# Altium project Smart Power Supply Unit-v4.0.0.PrjPcb
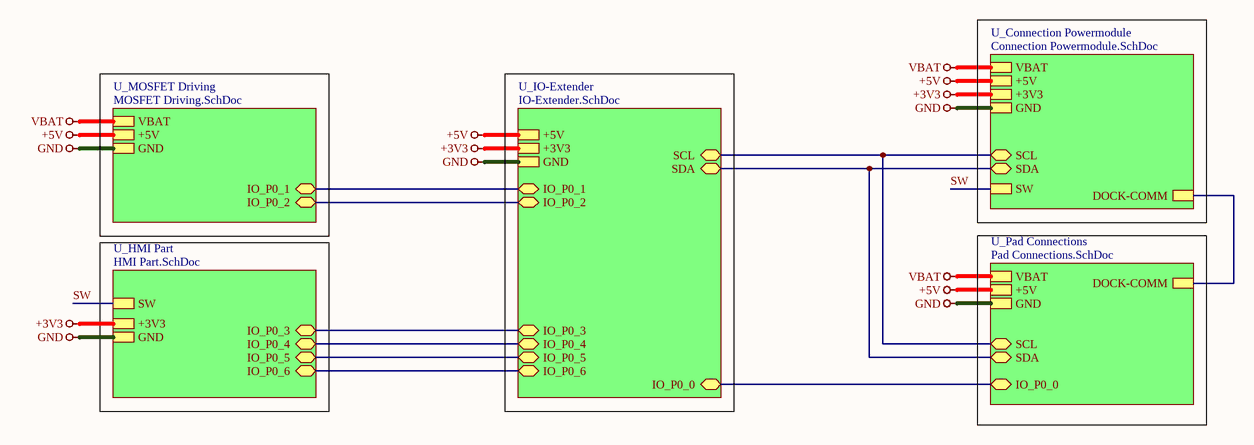
[diagram p0: Top-Sheet.SchDoc]
6 sheets, 47 parts. Net scope: hierarchical (ports join the sheet entries above them; power ports are global).
Board file: PCB_SPSU-v4.0.0.PcbDoc
Sheets:
  Top-Sheet.SchDoc
    U_IO-Extender = IO-Extender.SchDoc
    U_Connection Powermodule = Connection Powermodule.SchDoc
    U_HMI Part = HMI Part.SchDoc
    U_Pad Connections = Pad Connections.SchDoc
    U_MOSFET Driving = MOSFET Driving.SchDoc

## Sheet Top-Sheet.SchDoc
size A4; SheetNumber: 1; SheetTotal: 6

### Sub-sheets
U_Connection Powermodule = Connection Powermodule.SchDoc: VBAT, +5V, GND, SCL (bidir), SDA (bidir), SW, DOCK-COMM, +3V3
U_HMI Part = HMI Part.SchDoc: SW, IO_P0_3 (bidir), IO_P0_4 (bidir), IO_P0_5 (bidir), IO_P0_6 (bidir), +3V3, GND
U_IO-Extender = IO-Extender.SchDoc: GND, +5V, SCL (bidir), SDA (bidir), IO_P0_0 (bidir), IO_P0_1 (bidir), IO_P0_2 (bidir), IO_P0_3 (bidir), IO_P0_4 (bidir), IO_P0_5 (bidir), IO_P0_6 (bidir), +3V3
U_MOSFET Driving = MOSFET Driving.SchDoc: VBAT, +5V, GND, IO_P0_1 (bidir), IO_P0_2 (bidir)
U_Pad Connections = Pad Connections.SchDoc: VBAT, +5V, GND, SCL (bidir), SDA (bidir), IO_P0_0 (bidir), DOCK-COMM

### Nets
+3V3: sheet U_IO-Extender/+3V3, sheet U_Connection Powermodule/+3V3, sheet U_HMI Part/+3V3
+5V: sheet U_IO-Extender/+5V, sheet U_Connection Powermodule/+5V, sheet U_Pad Connections/+5V, sheet U_MOSFET Driving/+5V
GND: sheet U_IO-Extender/GND, sheet U_Connection Powermodule/GND, sheet U_HMI Part/GND, sheet U_Pad Connections/GND, sheet U_MOSFET Driving/GND
VBAT: sheet U_Connection Powermodule/VBAT, sheet U_Pad Connections/VBAT, sheet U_MOSFET Driving/VBAT
DOCK-COMM: sheet U_Connection Powermodule/DOCK-COMM, sheet U_Pad Connections/DOCK-COMM
IO_P0_0: sheet U_IO-Extender/IO_P0_0, sheet U_Pad Connections/IO_P0_0
IO_P0_1: sheet U_IO-Extender/IO_P0_1, sheet U_MOSFET Driving/IO_P0_1
IO_P0_2: sheet U_IO-Extender/IO_P0_2, sheet U_MOSFET Driving/IO_P0_2
IO_P0_3: sheet U_IO-Extender/IO_P0_3, sheet U_HMI Part/IO_P0_3
IO_P0_4: sheet U_IO-Extender/IO_P0_4, sheet U_HMI Part/IO_P0_4
IO_P0_5: sheet U_IO-Extender/IO_P0_5, sheet U_HMI Part/IO_P0_5
IO_P0_6: sheet U_IO-Extender/IO_P0_6, sheet U_HMI Part/IO_P0_6
SCL: sheet U_IO-Extender/SCL, sheet U_Connection Powermodule/SCL, sheet U_Pad Connections/SCL
SDA: sheet U_IO-Extender/SDA, sheet U_Connection Powermodule/SDA, sheet U_Pad Connections/SDA
SW: sheet U_Connection Powermodule/SW, sheet U_HMI Part/SW

### Notes on the sheet
- File:
- Title:
- Date:
- Page
- Num:
- Total:
- Drawn By: Huzaifa Ali

## Sheet IO-Extender.SchDoc
size A4; SheetNumber: 2; SheetTotal: 6
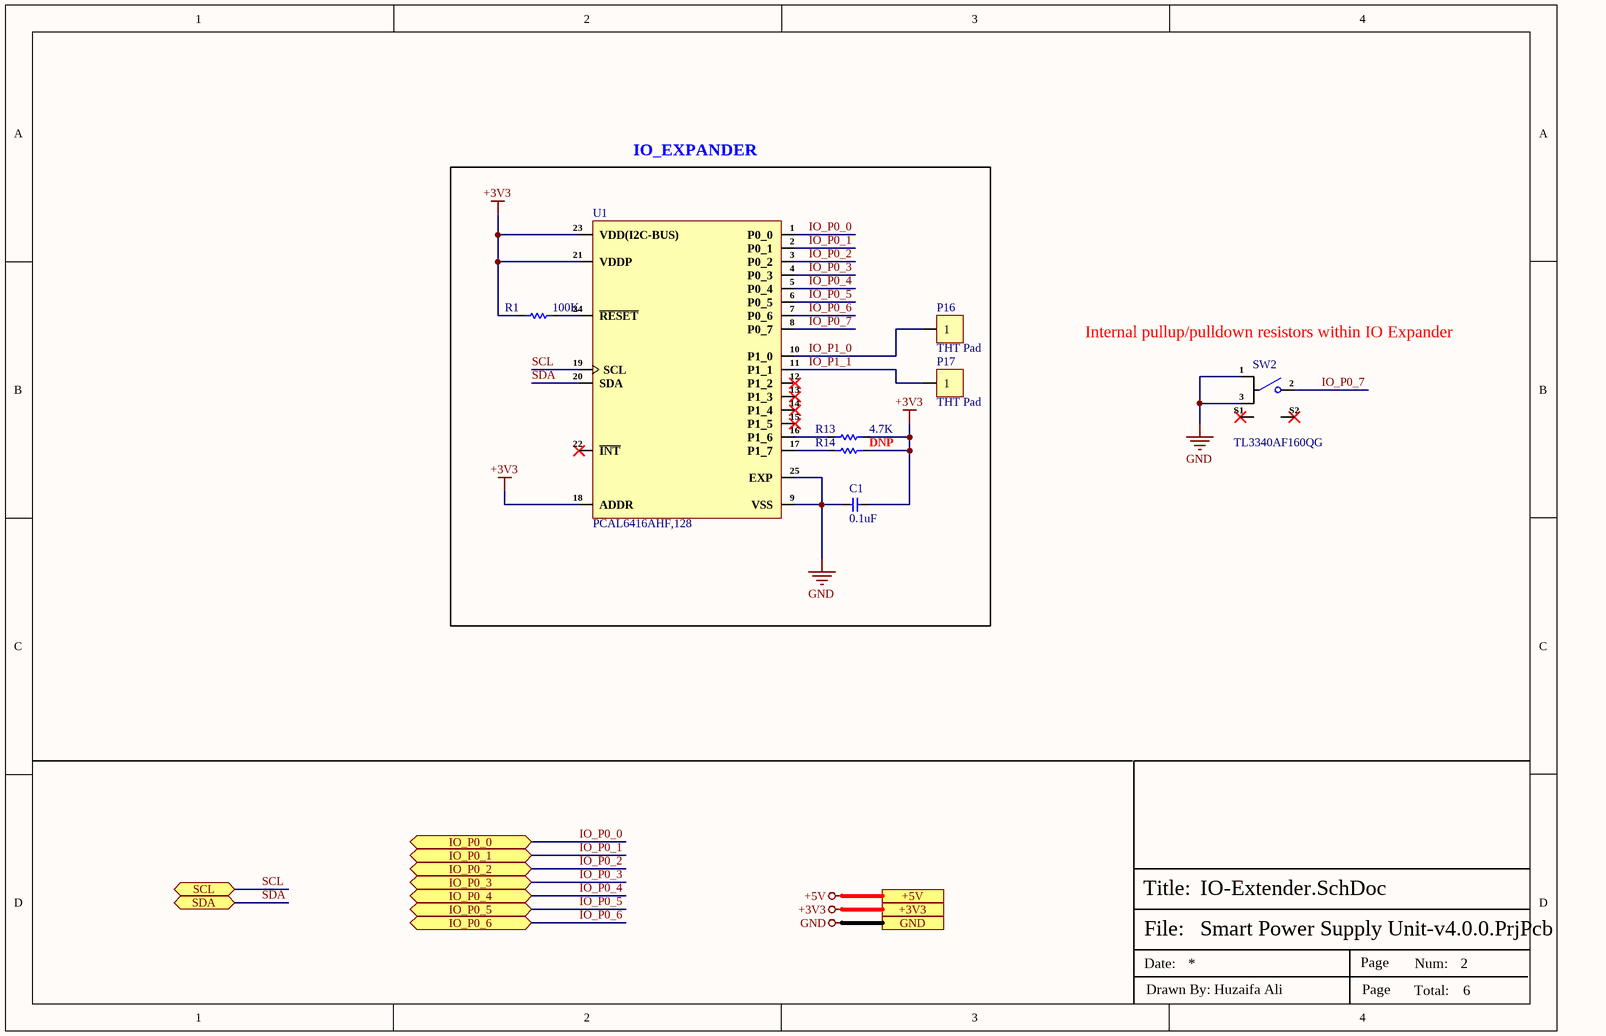
[diagram p1: IO-Extender.SchDoc]

### Parts
C1  0.1uF  [Cap-0603]
P16  THT Pad  [TH-0.75/0.6]  (no BOM)
P17  THT Pad  [TH-0.75/0.6]  (no BOM)
R1  100K  [Res-0603]
R13  4.7K  [Res-0603]
R14  DNP  [Res-0603]
SW2  TL3340AF160QG  [TL3340AF160QG]
U1  PCAL6416AHF,128  [QFN-24-EP(4x4)]

### Blocks framed on the sheet
IO_EXPANDER: C1 P16 P17 R1 R13 R14 U1

### Ports
+3V3 (see Top-Sheet[2B], Connection Powermodule[2D], HMI Part[3D]), +5V (see Top-Sheet[2B], Connection Powermodule[2D], MOSFET Driving[2D], Pad Connections[3D]), GND (see Top-Sheet[2B], Connection Powermodule[2D], HMI Part[3D], MOSFET Driving[2D], Pad Connections[3D]), IO_P0_0 (bidir, see Top-Sheet[3C], Pad Connections[1D]), IO_P0_1 (bidir, see Top-Sheet[2B], MOSFET Driving[1D]), IO_P0_2 (bidir, see Top-Sheet[2B], MOSFET Driving[1D]), IO_P0_3 (bidir, see Top-Sheet[2B], HMI Part[1D]), IO_P0_4 (bidir, see Top-Sheet[2B], HMI Part[1D]), IO_P0_5 (bidir, see Top-Sheet[2B], HMI Part[1D]), IO_P0_6 (bidir, see Top-Sheet[2B], HMI Part[1D]), SCL (bidir, see Top-Sheet[3B], Connection Powermodule[1D], Pad Connections[1D]), SDA (bidir, see Top-Sheet[3B], Connection Powermodule[1D], Pad Connections[1D])

### Nets
+3V3: C1.2 R1.2 R13.2 R14.2 U1.18(ADDR) U1.21(VDDP) U1.23(VDD(I2C-BUS)) ; port +3V3
GND: C1.1 SW2.1(COM_1) SW2.3(COM_2) U1.9(VSS) U1.25(EXP) ; port GND
IO_P0_0: U1.1(P0_0) ; port IO_P0_0
IO_P0_1: U1.2(P0_1) ; port IO_P0_1
IO_P0_2: U1.3(P0_2) ; port IO_P0_2
IO_P0_3: U1.4(P0_3) ; port IO_P0_3
IO_P0_4: U1.5(P0_4) ; port IO_P0_4
IO_P0_5: U1.6(P0_5) ; port IO_P0_5
IO_P0_6: U1.7(P0_6) ; port IO_P0_6
IO_P0_7: SW2.2(NO) U1.8(P0_7)
IO_P1_0: P16.1 U1.10(P1_0)
IO_P1_1: P17.1 U1.11(P1_1)
SCL: U1.19(SCL) ; port SCL
SDA: U1.20(SDA) ; port SDA
NetR1_1: R1.1 U1.24(~{RESET})
NetR13_1: R13.1 U1.16(P1_6)
NetR14_1: R14.1 U1.17(P1_7)

Not connected (* = marked no-connect by the designer): SW2 S1(GND)* S2(GND)*; U1 12(P1_2)* 13(P1_3)* 14(P1_4)* 15(P1_5)* 22(~{INT})*

### Notes on the sheet
- (near SW2) Internal pullup/pulldown resistors within IO Expander
- File:
- Title:
- Date:
- Page
- Num:
- Total:
- Drawn By: Huzaifa Ali

### Library data of the parts
C1 = CC0603KRX7R0BB104: CAP CER 0.1UF 100V X7R 0603; Manufacturer: Yageo; Capacitance: 100nF; Tolerance: 10%; Item Type: Capacitor; Supplier 1: Digi-Key; Manufacturer Part Number: CC0603KRX7R0BB104; RoHS: Yes; Category: Ceramic Capacitors; Stock 1: 60476; Pricing 1: 1=0.19000, 10=0.13500, 50=0.07680, 100=0.06370, 500=0.04466, 1000=0.03696 (USD); Mount: Surface Mount; Case/Package: 0603; Case Code (Metric): 1608; Case Code (Imperial): 0603; Weight: 7.1E-05oz; Min Operating Temperature: -55°C; Max Operating Temperature: 125°C; Package Quantity: 4000; Voltage Rating: 100V; Packaging: Tape and Reel; Dielectric: X7R; Termination: SMD/SMT; Resistor Type: Ceramic; Voltage Rating (DC): 100V; Series: CC; Length: 0.063inch; Width: 0.031inch; Thickness: 0.035inch; Depth: 0.8mm; Lead Free: Lead Free; RoHS Compliant: Yes; ComponentLink1URL: https://datasheet.ciiva.com/6277/mlccorderingcode-6277030.pdf?src-supplier=Digi-Key; ComponentLink1Description: https://datasheet.ciiva.com/6277/mlccorderingcode-6277030.pdf?src-supplier=Digi-Key; ComponentLink2URL: https://datasheet.ciiva.com/6277/mlccorderingcode-6277081.pdf?src-supplier=Digi-Key; ComponentLink2Description: https://datasheet.ciiva.com/6277/mlccorderingcode-6277081.pdf?src-supplier=Digi-Key; ComponentLink3URL: https://datasheet.ciiva.com/6277/mlccorderingcode-6277082.pdf?src-supplier=Digi-Key; ComponentLink3Description: https://datasheet.ciiva.com/6277/mlccorderingcode-6277082.pdf?src-supplier=Digi-Key; Supplier Part Number 1: 311-1523-1-ND; LCSC Part Number: C113803
P16 P17 = TH-0.75/0.6
R1 = RC0603JR-07100KL: RES 100K OHM 5% 1/10W 0603; Manufacturer: Yageo; Resistance: 100kR; Temperature Coefficient: 100ppm/°C; Voltage Rating: 50V; Power Rating: 100mW; Item Type: Resistor; Supplier 1: Digi-Key; Manufacturer Part Number: RC0603JR-07100KL; RoHS: Yes; Category: Chip SMD Resistors; Stock 1: 1210037; Pricing 1: 1=0.10000, 10=0.02000, 100=0.00800, 1000=0.00360, 2500=0.00312 (USD); Case/Package: 0603; Number of Pins: 2; Contact Plating: Tin,Matte; Case Code (Imperial): 0603; Case Code (Metric): 1608; Size Code: 0603; Min Operating Temperature: -55°C; Max Operating Temperature: 155°C; Tolerance: 5%; Resistor Type: Thick Film; Packaging: Tape and Reel; Voltage Rating (DC): 50V; Termination: SMD/SMT; Features: Moisture Resistant; Series: RC; Max Power Dissipation: 100mW; Number of Terminations: 2; Resistance Tolerance: 5%; Width: 0.8mm; Radiation Hardening: No; REACH SVHC: No SVHC; Lead Free: Lead Free; RoHS Compliant: Yes; ComponentLink1URL: https://datasheet.ciiva.com/7746/443971-7746424.pdf?src-supplier=Element14; ComponentLink1Description: https://datasheet.ciiva.com/7746/443971-7746424.pdf?src-supplier=Element14; ComponentLink2URL: https://datasheet.ciiva.com/7983/443971-7983686.pdf?src-supplier=Element14; ComponentLink2Description: https://datasheet.ciiva.com/7983/443971-7983686.pdf?src-supplier=Element14; ComponentLink3URL: https://datasheet.ciiva.com/7746/443971-7746423.pdf?src-supplier=Element14; ComponentLink3Description: https://datasheet.ciiva.com/7746/443971-7746423.pdf?src-supplier=Element14; ComponentLink4URL: https://datasheet.ciiva.com/8887/pyu-rc0603-51-rohs-l-4-8887903.pdf?src-supplier=Avnet; ComponentLink4Description: https://datasheet.ciiva.com/8887/pyu-rc0603-51-rohs-l-4-8887903.pdf?src-supplier=Avnet; Supplier Part Number 1: 311-100KGRCT-ND; LCSC Part Number: C100048
R13 = RC0603FR-074K7L: RES SMD 4.7K OHM 1% 1/10W 0603; Manufacturer: Yageo; Item Type: Resistor; Manufacturer Part Number: RC0603FR-074K7L; Package: 0603; ComponentLink7Description: LCSC; ComponentLink7URL: https://www.lcsc.com/product-detail/Chip-Resistor-Surface-Mount_YAGEO-RC0603FR-074K7L_C99782.html; LCSC Part Number: C99782
R14 = DNP: Item Type: Resistor; Package: 0603; ComponentLink1Description: LCSC
SW2 = TL3340AF160QG: Switch Tactile N.O. SPST Round Button Gull Wing 0.05A 12VDC 100000Cycles 1.57N SMD; Manufacturer: E-Switch; Actuator Material: Polyphthalamide; Number of Positions: 2NUMBER; Contact Current Rating: 50mA; Operating Force: 160gf; Voltage Rating (DC): 12V; Contact Resistance: 500mR; Illumination Type: Non-Illuminated,Illuminated; Switch Travel: 0.2mm; Switch Function: Off-Mom; Actuator Type: Standard; Actuator Length: 0.85mm; Supplier: Future Electronics; Supplier Part Number: 9232661; Manufacturer Part Number: TL3340AF160QG; RoHS: Yes; Category: Tactile Switches; Stock: 16000; Pricing: 2000=0.27 (USD); Mounting Technology: Surface Mount; Case/Package: SMD/SMT; Contact Material: Stainless Steel,Silver; Contact Plating: Stainless Steel,Silver; Color: White; Mechanical Life: 100000Cycles; Housing Material: Polyphthalamide; Min Operating Temperature: -35°C; Max Operating Temperature: 85°C; Throw Configuration: SPST; Package Quantity: 1; Packaging: Tape and Reel; Current Rating: 50mA; Max Voltage Rating (DC): 12V; Termination: Gull Wing; Electrical Life: 100000Cycles; Orientation: Right Angle; Series: TL3340; Height: 3.55mm; Size: 3.3mm; Reach SVHC Compliant: No; Lead Free: 5697LeadFree; RoHS Compliant: Yes; ComponentLink1URL: https://datasheet.ciiva.com/7637/tl3340-7637667.pdf?src-supplier=Element14; ComponentLink1Description: https://datasheet.ciiva.com/7637/tl3340-7637667.pdf?src-supplier=Element14; ComponentLink2URL: https://datasheet.ciiva.com/5284/tl3340-28153-5284108.pdf?src-supplier=Mouser; ComponentLink2Description: https://datasheet.ciiva.com/5284/tl3340-28153-5284108.pdf?src-supplier=Mouser; ComponentLink3URL: https://datasheet.ciiva.com/2900/p021301b-2900825.pdf?src-supplier=Digikey; ComponentLink3Description: https://datasheet.ciiva.com/2900/p021301b-2900825.pdf?src-supplier=Digikey; ComponentLink4URL: https://datasheet.ciiva.com/2900/p021301b-2900826.pdf?src-supplier=Digikey; ComponentLink4Description: https://datasheet.ciiva.com/2900/p021301b-2900826.pdf?src-supplier=Digikey; ComponentLink5URL: https://datasheet.ciiva.com/2900/p021301b-2900827.pdf?src-supplier=Digikey; ComponentLink5Description: https://datasheet.ciiva.com/2900/p021301b-2900827.pdf?src-supplier=Digikey
U1 = PCAL6416AHF,128: IC XPND 400KHZ I2C SMBUS 24HWQFN; Manufacturer: NXP Semiconductors; Min Supply Voltage: 1.65V; Max Supply Voltage: 5.5V; Output Current: 25mA; Number of I/Os: 16; Clock Frequency: 100kHz; Nominal Supply Current: 1.1mA; Supplier: Avnet; Supplier Part Number: 75X0096; Manufacturer Part Number: PCAL6416AHF,128; RoHS: Yes; Category: Interface ICs; Stock: 5086; Pricing: 1=1.23, 10=1.05, 25=0.969, 50=0.887 (USD); Mounting Technology: Surface Mount; Pins: 24; Min Operating Temperature: -40°C; Max Operating Temperature: 85°C; Packaging: Tape and Reel; Package Quantity: 1; Interface: I2C; Frequency: 400kHz; Series: -; Height: 800um; Reach SVHC Compliant: No; Lead Free: Lead Free; RoHS Compliant: Yes; ComponentLink1URL: https://datasheet.ciiva.com/46433/1845292-46433847.pdf?src-supplier=Element14; ComponentLink1Description: https://datasheet.ciiva.com/46433/1845292-46433847.pdf?src-supplier=Element14; ComponentLink2URL: https://datasheet.ciiva.com/6633/pcal6416a-6633094.pdf?src-supplier=Digikey; ComponentLink2Description: https://datasheet.ciiva.com/6633/pcal6416a-6633094.pdf?src-supplier=Digikey; ComponentLink3URL: https://datasheet.ciiva.com/6633/pcal6416a-6633096.pdf?src-supplier=Digikey; ComponentLink3Description: https://datasheet.ciiva.com/6633/pcal6416a-6633096.pdf?src-supplier=Digikey; LCSC Part Number: C2652287; Item Type: IC

## Sheet Connection Powermodule.SchDoc
size A4; SheetNumber: 3; SheetTotal: 6
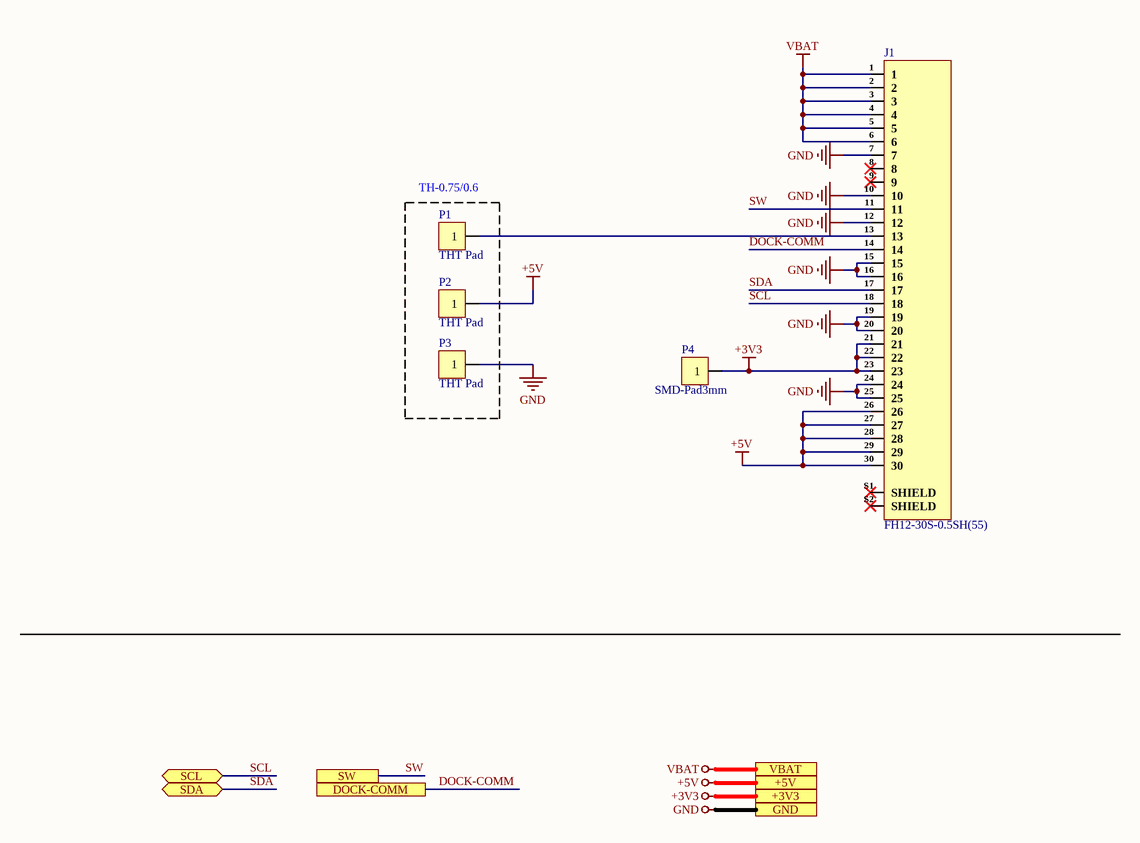
[diagram p2: Connection Powermodule.SchDoc]

### Parts
J1  FH12-30S-0.5SH(55)  [FH12-30S-0.5SH(55)]
P1  THT Pad  [TH-0.75/0.6]  (no BOM)
P2  THT Pad  [TH-0.75/0.6]  (no BOM)
P3  THT Pad  [TH-0.75/0.6]  (no BOM)
P4  SMD-Pad3mm  [3mm SMD PAD]  (no BOM)

### Blocks framed on the sheet
TH-0.75/0.6: P1-P3

### Ports
+3V3 (see Top-Sheet[3A], IO-Extender[3D]), +5V (see Top-Sheet[3A], HMI Part[3D], IO-Extender[3D], MOSFET Driving[2D], Pad Connections[3D]), DOCK-COMM (see Top-Sheet[4B], Pad Connections[1D]), GND (see Top-Sheet[3A], HMI Part[3D], IO-Extender[3D], MOSFET Driving[2D], Pad Connections[3D]), SCL (bidir, see Top-Sheet[3B], IO-Extender[1D], Pad Connections[1D]), SDA (bidir, see Top-Sheet[3B], IO-Extender[1D], Pad Connections[1D]), SW (see Top-Sheet[3B], HMI Part[2D]), VBAT (see Top-Sheet[3A], MOSFET Driving[2D], Pad Connections[3D])

### Nets
+3V3: J1.21 J1.22 J1.23 P4.1 ; port +3V3
+5V: J1.26 J1.27 J1.28 J1.29 J1.30 P2.1 ; port +5V
GND: J1.7 J1.10 J1.12 J1.15 J1.16 J1.19 J1.20 J1.24 J1.25 P3.1 ; port GND
VBAT: J1.1 J1.2 J1.3 J1.4 J1.5 J1.6 ; port VBAT
DOCK-COMM: J1.14 ; port DOCK-COMM
SCL: J1.18 ; port SCL
SDA: J1.17 ; port SDA
SW: J1.11 ; port SW
NetJ1_13: J1.13 P1.1

Not connected (* = marked no-connect by the designer): J1 8* 9* S1(SHIELD)* S2(SHIELD)*

### Notes on the sheet
- File:
- Title:
- Date:
- Page
- Num:
- Total:
- Drawn By: Huzaifa Ali

### Library data of the parts
J1 = FH12-30S-0.5SH(55): CONN FFC BOTTOM 30POS 0.5MM R/A; Manufacturer: Hirose; Actuator Material: Polyphenylene; Actuator Color: Brown; Contact Resistance: 50mR; Current Rating: 500mA; Gender: Female; Voltage Rating: 50V; Max Current Rating: 400mA; Mating Cycles: 20; Number of Positions: 30; Insulation Resistance: 500MR; Wire/Cable Type: Straight; Connector Type: 4640ConnectorType; Contact Pitch: 500um; Item Type: FFC/FPC Connector; Supplier: Future Electronics; Supplier Part Number: 7018136; Manufacturer Part Number: FH12-30S-0.5SH(55); RoHS: Yes; Category: FFC / FPC; Stock: 1200; Pricing: 1=2.27, 15=2.07, 50=1.97, 250=1.85, 1000=1.75 (USD); Mounting Technology: Surface Mount; Contact Material: Bronze; Contact Plating: Gold; Color: Beige,Brown; Housing Color: Beige; Housing Material: Polyamide; Material: Polyamide; Min Operating Temperature: -40°C; Max Operating Temperature: 70°C; Number of Rows: 1; Package Quantity: 2000; Packaging: Tape and Reel; Voltage Rating (AC): 50V; Termination: Solder; Number of Contacts: 30; Max Voltage Rating (AC): 50V; Orientation: Right Angle; Series: FH12; Contact Location: Bottom; Contact Voltage Rating (AC): 50V; Length: 19.1mm; Width: 19.1mm; Lead Pitch: 0.5mm; Pitch: 0.5mm; Depth: 5.6mm; Radiation Hardening: No; Reach SVHC Compliant: No; Lead Free: Lead Free; Flammability Rating: UL94 V-0; RoHS Compliant: Yes; ComponentLink1URL: https://datasheet.ciiva.com/11745/0900766b80d985fc-11745247.pdf?src-supplier=Rs; ComponentLink1Description: https://datasheet.ciiva.com/11745/0900766b80d985fc-11745247.pdf?src-supplier=Rs; ComponentLink2URL: https://datasheet.ciiva.com/15176/getdatasheetpartid-439676-15176854.pdf?src-supplier=Verical; ComponentLink2Description: https://datasheet.ciiva.com/15176/getdatasheetpartid-439676-15176854.pdf?src-supplier=Verical; ComponentLink3URL: https://datasheet.ciiva.com/7661/58803-7661387.pdf?src-supplier=Element14; ComponentLink3Description: https://datasheet.ciiva.com/7661/58803-7661387.pdf?src-supplier=Element14; ComponentLink4URL: https://datasheet.ciiva.com/22630/58803-22630360.pdf?src-supplier=Farnell; ComponentLink4Description: https://datasheet.ciiva.com/22630/58803-22630360.pdf?src-supplier=Farnell; LCSC Part Number: C506793
P1-P3 = TH-0.75/0.6
P4 = SMD-Pad3mm: Wire Conncting PAD

## Sheet HMI Part.SchDoc
size A4; SheetNumber: 6; SheetTotal: 6
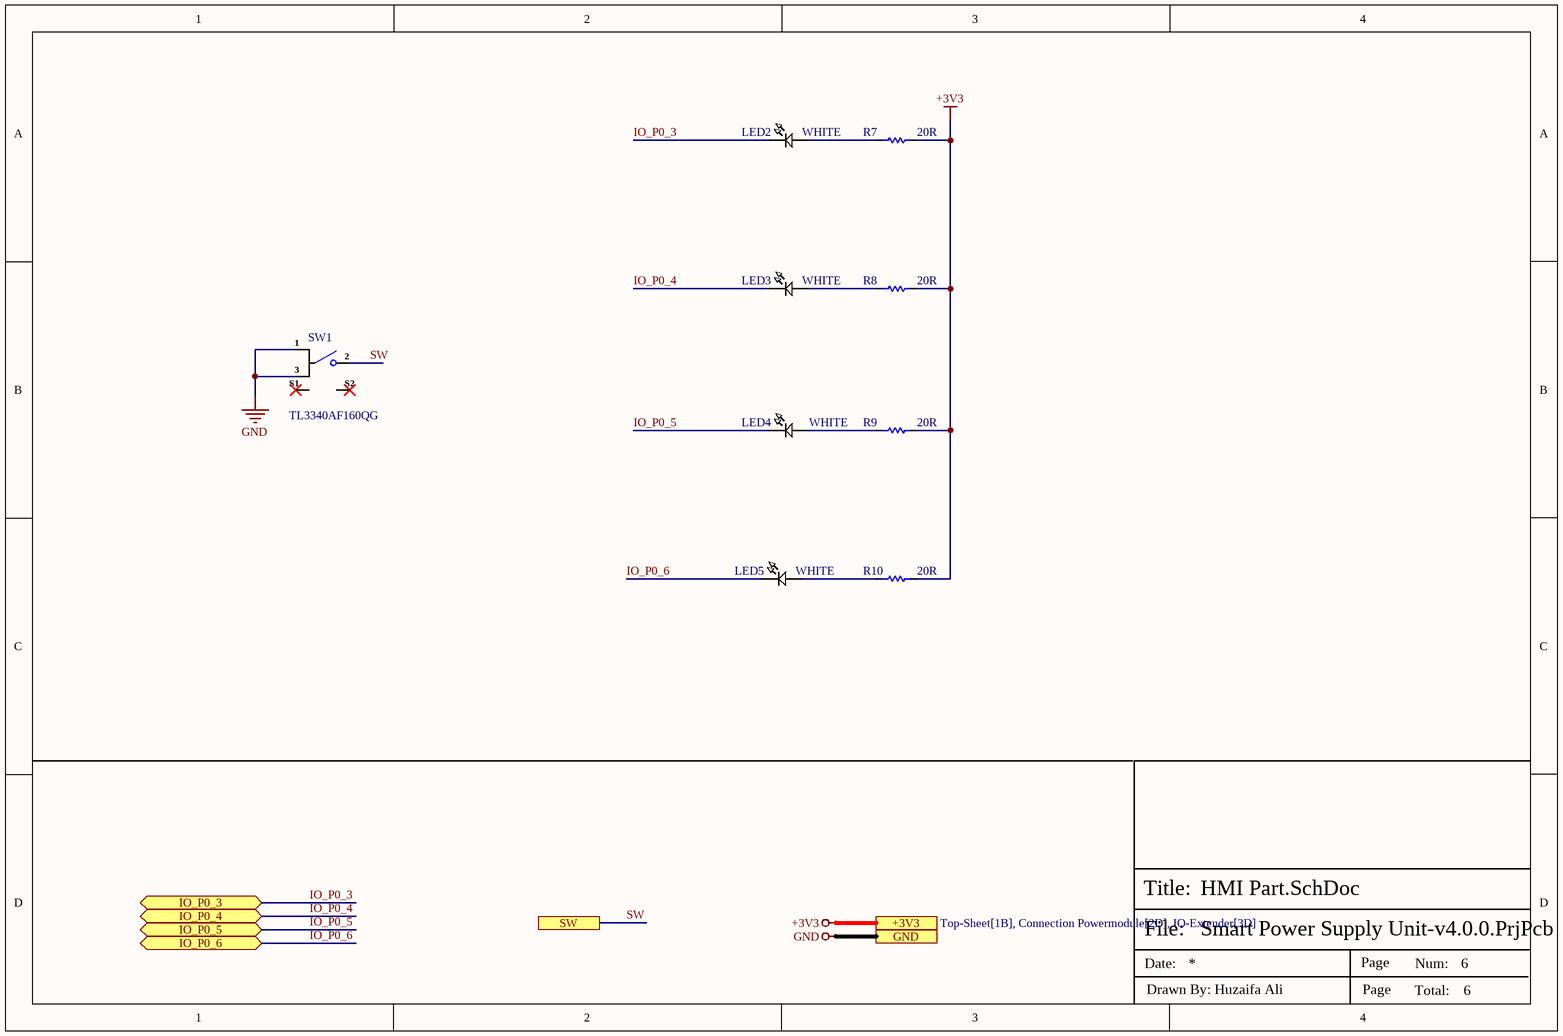
[diagram p3: HMI Part.SchDoc]

### Parts
LED2  WHITE  [LED-0603]
LED3  WHITE  [LED-0603]
LED4  WHITE  [LED-0603]
LED5  WHITE  [LED-0603]
R7  20R  [Res-0603]
R8  20R  [Res-0603]
R9  20R  [Res-0603]
R10  20R  [Res-0603]
SW1  TL3340AF160QG  [TL3340AF160QG]

### Ports
+3V3 (see Top-Sheet[1B], Connection Powermodule[2D], IO-Extender[3D]), GND (see Top-Sheet[1B], Connection Powermodule[2D], IO-Extender[3D], MOSFET Driving[2D], Pad Connections[3D]), IO_P0_3 (bidir, see Top-Sheet[2B], IO-Extender[2D]), IO_P0_4 (bidir, see Top-Sheet[2B], IO-Extender[2D]), IO_P0_5 (bidir, see Top-Sheet[2B], IO-Extender[2D]), IO_P0_6 (bidir, see Top-Sheet[2B], IO-Extender[2D]), SW (see Top-Sheet[1B], Connection Powermodule[1D])

### Nets
+3V3: R7.2 R8.2 R9.2 R10.2 ; port +3V3
GND: SW1.1(COM_1) SW1.3(COM_2) ; port GND
IO_P0_3: LED2.2 ; port IO_P0_3
IO_P0_4: LED3.2 ; port IO_P0_4
IO_P0_5: LED4.2 ; port IO_P0_5
IO_P0_6: LED5.2 ; port IO_P0_6
SW: SW1.2(NO) ; port SW
NetLED2_1: LED2.1 R7.1
NetLED3_1: LED3.1 R8.1
NetLED4_1: LED4.1 R9.1
NetLED5_1: LED5.1 R10.1

Not connected (* = marked no-connect by the designer): SW1 S1(GND)* S2(GND)*

### Notes on the sheet
- File:
- Title:
- Date:
- Page
- Num:
- Total:
- Drawn By: Huzaifa Ali

### Library data of the parts
LED2-LED5 = NCD0603W1: 5mA 200mcd~300mcd 雾状黄透镜 -30℃~+85℃ White 130° 72mW 2.6V~3.6V 0603 Light Emitting Diodes (LED) ROHS; Manufacturer: Foshan NationStar Optoelectronics; Manufacturer Part Number: NCD0603W1; Package: 0603; LCSC Part Number: C84265; Item Type: LED; ComponentLink1Description: LCSC; ComponentLink1URL: https://www.lcsc.com/product-detail/Light-Emitting-Diodes-LED_Foshan-NationStar-Optoelectronics-NCD0603W1_C84265.html
R7-R10 = 0603WAF200JT5E: 100mW Thick Film Resistors ±100ppm/℃ ±1% 20Ω 0603 Chip Resistor - Surface Mount ROHS; Manufacturer: UNI-ROYAL(Uniroyal Elec); Manufacturer Part Number: 0603WAF200JT5E; LCSC Part Number: C22950; Package: 0603; Item Type: Resistor; ComponentLink1Description: LCSC; ComponentLink1URL: https://www.lcsc.com/product-detail/Chip-Resistor-Surface-Mount_UNI-ROYAL-Uniroyal-Elec-0603WAF200JT5E_C22950.html
SW1 = TL3340AF160QG: as SW2 on sheet IO-Extender; Supplier: Future Electronics; Supplier Part Number: 9232661; Manufacturer Part Number: TL3340AF160QG; RoHS: Yes; Category: Tactile Switches; Stock: 16000; Pricing: 2000=0.27 (USD); Mounting Technology: Surface Mount; Case/Package: SMD/SMT; Contact Material: Stainless Steel,Silver; Contact Plating: Stainless Steel,Silver; Color: White; Mechanical Life: 100000Cycles; Housing Material: Polyphthalamide; Min Operating Temperature: -35°C; Max Operating Temperature: 85°C; Throw Configuration: SPST; Package Quantity: 1; Packaging: Tape and Reel; Current Rating: 50mA; Max Voltage Rating (DC): 12V; Termination: Gull Wing; Electrical Life: 100000Cycles; Orientation: Right Angle; Series: TL3340; Height: 3.55mm; Size: 3.3mm; Reach SVHC Compliant: No; Lead Free: 5697LeadFree; RoHS Compliant: Yes; ComponentLink1URL: https://datasheet.ciiva.com/7637/tl3340-7637667.pdf?src-supplier=Element14; ComponentLink1Description: https://datasheet.ciiva.com/7637/tl3340-7637667.pdf?src-supplier=Element14; ComponentLink2URL: https://datasheet.ciiva.com/5284/tl3340-28153-5284108.pdf?src-supplier=Mouser; ComponentLink2Description: https://datasheet.ciiva.com/5284/tl3340-28153-5284108.pdf?src-supplier=Mouser; ComponentLink3URL: https://datasheet.ciiva.com/2900/p021301b-2900825.pdf?src-supplier=Digikey; ComponentLink3Description: https://datasheet.ciiva.com/2900/p021301b-2900825.pdf?src-supplier=Digikey; ComponentLink4URL: https://datasheet.ciiva.com/2900/p021301b-2900826.pdf?src-supplier=Digikey; ComponentLink4Description: https://datasheet.ciiva.com/2900/p021301b-2900826.pdf?src-supplier=Digikey; ComponentLink5URL: https://datasheet.ciiva.com/2900/p021301b-2900827.pdf?src-supplier=Digikey; ComponentLink5Description: https://datasheet.ciiva.com/2900/p021301b-2900827.pdf?src-supplier=Digikey

## Sheet Pad Connections.SchDoc
size A4; SheetNumber: 5; SheetTotal: 6
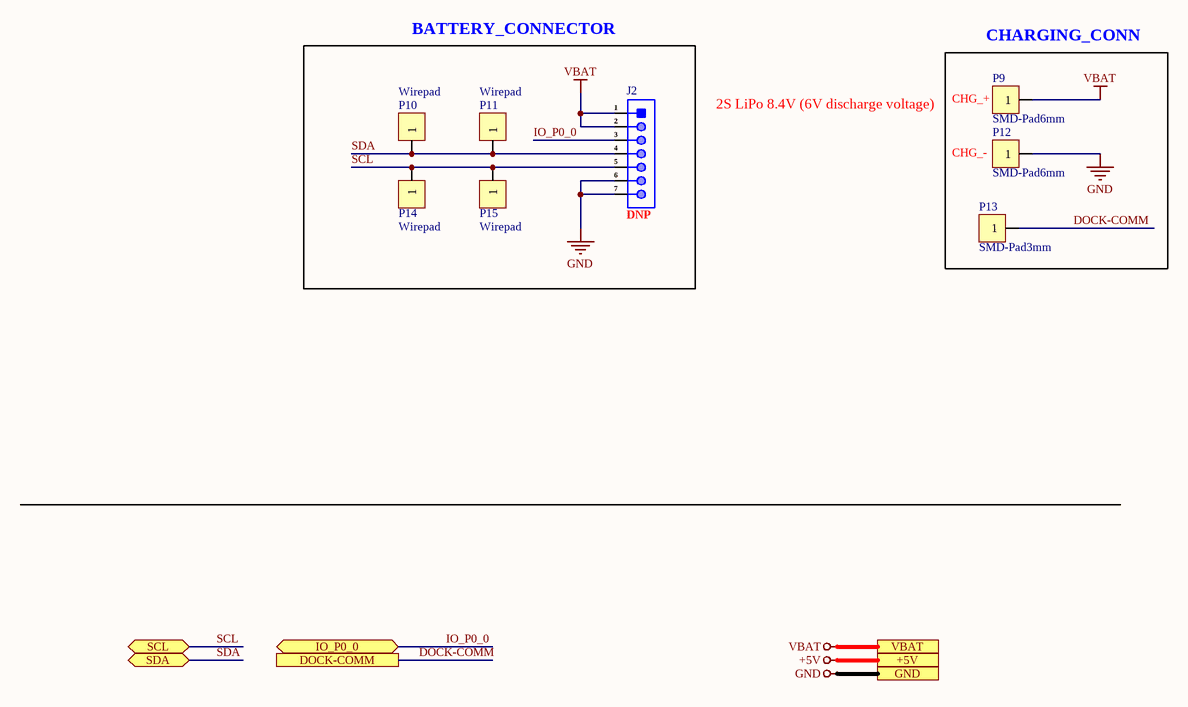
[diagram p4: Pad Connections.SchDoc]

### Parts
J2  DNP  [HDR 1X7]
P9  SMD-Pad6mm  [6.0mm-SMD Pad]  (no BOM)
P10  Wirepad  [Wirepad]
P11  Wirepad  [Wirepad]
P12  SMD-Pad6mm  [6.0mm-SMD Pad]  (no BOM)
P13  SMD-Pad3mm  [3mm SMD PAD]  (no BOM)
P14  Wirepad  [Wirepad]
P15  Wirepad  [Wirepad]

### Blocks framed on the sheet
BATTERY_CONNECTOR: J2 P10 P11 P14 P15
CHARGING_CONN: P9 P12 P13

### Ports
+5V (see Top-Sheet[3B], Connection Powermodule[2D], IO-Extender[3D], MOSFET Driving[2D]), DOCK-COMM (see Top-Sheet[4B], Connection Powermodule[1D]), GND (see Top-Sheet[3B], Connection Powermodule[2D], HMI Part[3D], IO-Extender[3D], MOSFET Driving[2D]), IO_P0_0 (bidir, see Top-Sheet[3C], IO-Extender[2D]), SCL (bidir, see Top-Sheet[3B], Connection Powermodule[1D], IO-Extender[1D]), SDA (bidir, see Top-Sheet[3B], Connection Powermodule[1D], IO-Extender[1D]), VBAT (see Top-Sheet[3B], Connection Powermodule[2D], MOSFET Driving[2D])

### Nets
GND: J2.6 J2.7 P12.1 ; port GND
VBAT: J2.1 J2.2 P9.1 ; port VBAT
DOCK-COMM: P13.1 ; port DOCK-COMM
IO_P0_0: J2.3 ; port IO_P0_0
SCL: J2.5 P14.1 P15.1 ; port SCL
SDA: J2.4 P10.1 P11.1 ; port SDA

### Notes on the sheet
- 2S LiPo 8.4V (6V discharge voltage)
- (near P9) CHG_+
- (near P12) CHG_-
- File:
- Title:
- Date:
- Page
- Num:
- Total:
- Drawn By: Huzaifa Ali

### Library data of the parts
J2 = PZ254V-11-07P: Manufacturer: XFCN; Item Type: Header; Manufacturer Part Number: PZ254V-11-07P; LCSC Part Number: C492406; Package: 2.54mm; ComponentLink1Description: LCSC; ComponentLink1URL: https://www.lcsc.com/product-detail/Pin-Headers_XFCN-PZ254V-11-07P_C492406.html
P13 = SMD-Pad3mm: Wire Conncting PAD

## Sheet MOSFET Driving.SchDoc
size A4; SheetNumber: 4; SheetTotal: 6
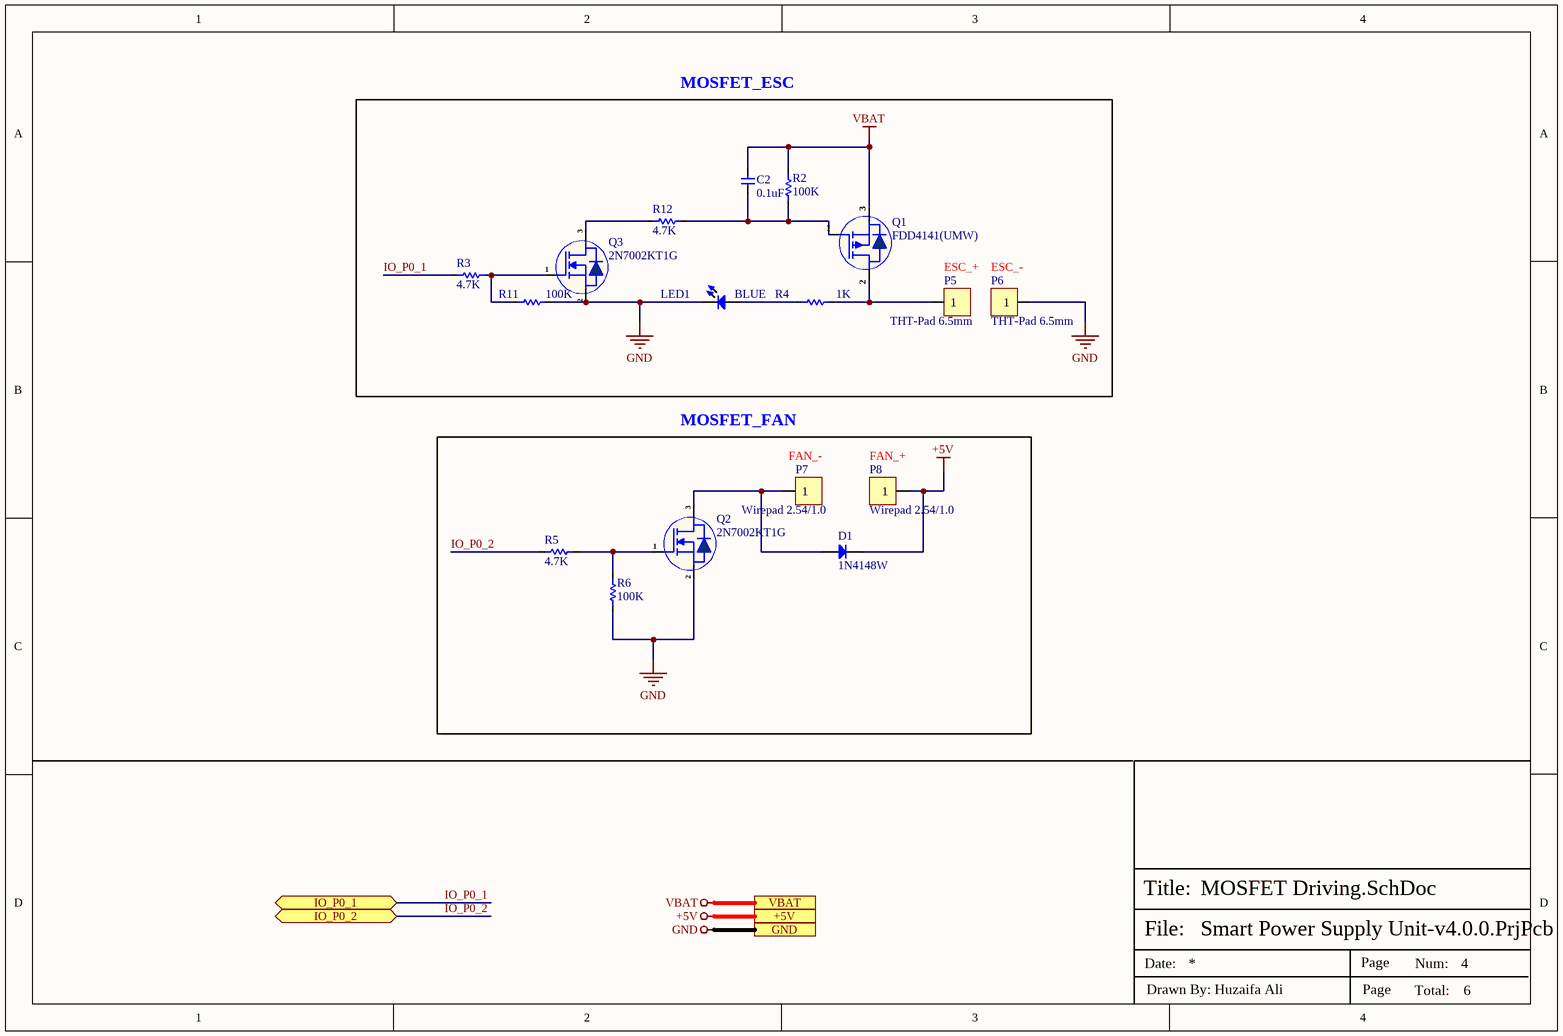
[diagram p5: MOSFET Driving.SchDoc]

### Parts
C2  0.1uF  [Cap-0603]
D1  1N4148W  [SOD-123]
LED1  BLUE  [LED-0603]
P5  THT-Pad 6.5mm  [6.5mm-THTPad]  (no BOM)
P6  THT-Pad 6.5mm  [6.5mm-THTPad]  (no BOM)
P7  Wirepad 2.54/1.0  [Wirepad 2.54/1.0]  (no BOM)
P8  Wirepad 2.54/1.0  [Wirepad 2.54/1.0]  (no BOM)
Q1  FDD4141(UMW)  [TO-252-2L]
Q2  2N7002KT1G  [SOT-23]
Q3  2N7002KT1G  [SOT-23]
R2  100K  [Res-0603]
R3  4.7K  [Res-0603]
R4  1K  [Res-0603]
R5  4.7K  [Res-0603]
R6  100K  [Res-0603]
R11  100K  [Res-0603]
R12  4.7K  [Res-0603]

### Blocks framed on the sheet
MOSFET_ESC: C2 LED1 P5 P6 Q1 Q3 R2-R4 R11 R12
MOSFET_FAN: D1 P7 P8 Q2 R5 R6

### Ports
+5V (see Top-Sheet[1B], Connection Powermodule[2D], IO-Extender[3D], Pad Connections[3D]), GND (see Top-Sheet[1B], Connection Powermodule[2D], HMI Part[3D], IO-Extender[3D], Pad Connections[3D]), IO_P0_1 (bidir, see Top-Sheet[2B], IO-Extender[2D]), IO_P0_2 (bidir, see Top-Sheet[2B], IO-Extender[2D]), VBAT (see Top-Sheet[1A], Connection Powermodule[2D], Pad Connections[3D])

### Nets
+5V: D1.2(K) P8.1 ; port +5V
GND: LED1.2 P6.1 Q2.2(S) Q3.2(S) R6.1 R11.1 ; port GND
VBAT: C2.2 Q1.3(S) R2.2 ; port VBAT
IO_P0_1: R3.1 ; port IO_P0_1
IO_P0_2: R5.1 ; port IO_P0_2
NetC2_1: C2.1 Q1.1(G) R2.1 R12.2
NetD1_1: D1.1(A) P7.1 Q2.3(D)
NetLED1_1: LED1.1 R4.1
NetP5_1: P5.1 Q1.2(D) R4.2
NetQ2_1: Q2.1(G) R5.2 R6.2
NetQ3_1: Q3.1(G) R3.2 R11.2
NetQ3_3: Q3.3(D) R12.1

### Notes on the sheet
- (near P5) ESC_+
- (near P6) ESC_-
- (near P7) FAN_-
- (near P8) FAN_+
- File:
- Title:
- Date:
- Page
- Num:
- Total:
- Drawn By: Huzaifa Ali

### Library data of the parts
C2 = CC0603KRX7R0BB104: as C1 on sheet IO-Extender; Supplier 1: Digi-Key; Manufacturer Part Number: CC0603KRX7R0BB104; RoHS: Yes; Category: Ceramic Capacitors; Stock 1: 60476; Pricing 1: 1=0.19000, 10=0.13500, 50=0.07680, 100=0.06370, 500=0.04466, 1000=0.03696 (USD); Mount: Surface Mount; Case/Package: 0603; Case Code (Metric): 1608; Case Code (Imperial): 0603; Weight: 7.1E-05oz; Min Operating Temperature: -55°C; Max Operating Temperature: 125°C; Package Quantity: 4000; Voltage Rating: 100V; Packaging: Tape and Reel; Dielectric: X7R; Termination: SMD/SMT; Resistor Type: Ceramic; Voltage Rating (DC): 100V; Series: CC; Length: 0.063inch; Width: 0.031inch; Thickness: 0.035inch; Depth: 0.8mm; Lead Free: Lead Free; RoHS Compliant: Yes; ComponentLink1URL: https://datasheet.ciiva.com/6277/mlccorderingcode-6277030.pdf?src-supplier=Digi-Key; ComponentLink1Description: https://datasheet.ciiva.com/6277/mlccorderingcode-6277030.pdf?src-supplier=Digi-Key; ComponentLink2URL: https://datasheet.ciiva.com/6277/mlccorderingcode-6277081.pdf?src-supplier=Digi-Key; ComponentLink2Description: https://datasheet.ciiva.com/6277/mlccorderingcode-6277081.pdf?src-supplier=Digi-Key; ComponentLink3URL: https://datasheet.ciiva.com/6277/mlccorderingcode-6277082.pdf?src-supplier=Digi-Key; ComponentLink3Description: https://datasheet.ciiva.com/6277/mlccorderingcode-6277082.pdf?src-supplier=Digi-Key; Supplier Part Number 1: 311-1523-1-ND; LCSC Part Number: C113803
D1 = 1N4148W: Manufacturer: JSMSEMI; Item: Diode; Manufacturer Part Number: 1N4148W; LCSC Part Number: C917030; ComponentLink1Description: LCSC; ComponentLink1URL: https://www.lcsc.com/product-detail/Switching-Diode_JSMSEMI-1N4148W_C917030.html; Package: SOD-123
LED1 = NCD0603B1: 10mA 无色透明透镜 80mcd~220mcd 463nm~475nm -30℃~+85℃ Blue 130° 72mW 2.6V~3.6V 0603 Light Emitting Diodes (LED) ROHS; Manufacturer: Foshan NationStar Optoelectronics; Manufacturer Part Number: NCD0603B1; Package: 0603; LCSC Part Number: C84266; Item Type: LED; ComponentLink1Description: LCSC; ComponentLink1URL: https://www.lcsc.com/product-detail/Light-Emitting-Diodes-LED_Foshan-NationStar-Optoelectronics-NCD0603B1_C84266.html
Q1 = FDD4141(UMW): TO-252 MOSFETs ROHS; Item Type: MOSFET; Manufacturer: UMW; Manufacturer Part Number: FDD4141(UMW); Package: TO-252; LCSC Part Number: C5346825
Q2 Q3 = 2N7002KT1G: MOSFET N-CH 60V 320MA SOT23-3; Manufacturer: ON Semiconductor; Input Capacitance: 24.5pF; Max Power Dissipation: 420mW; Rds On Max: 1.6R; Rise Time: 9ns; Nominal Vgs: 2.3V; Number of Elements: 1; Power Dissipation: 300mW; Turn-Off Delay Time: 55.8ns; Turn-On Delay Time: 12.2ns; Element Configuration: Single; Gate to Source Voltage (Vgs): 20V; Polarity: N-CHANNEL; Number of Channels: 1NUMBER; Supplier: Future Electronics; Supplier Part Number: 3445699; Manufacturer Part Number: 2N7002KT1G; RoHS: Yes; Category: MOSFETs; Stock: 51000; Pricing: 3000=0.0238, 12000=0.0228, 45000=0.0218, 75000=0.0215, 150000=0.0204 (USD); Case/Package: SOT-23-3; Pins: 3; Contact Plating: Tin,Matte; Min Operating Temperature: -55°C; Max Operating Temperature: 150°C; Packaging: Tape and Reel; Continuous Drain Current (ID): 320mA; Package Quantity: 1; Drain to Source Breakdown Voltage: 60V; Fall Time: 9ns; Drain to Source Resistance: 1.6R; Threshold Voltage: 2.3V; Series: -; Drain-source On Resistance-Max: 1.6R; Length: 3.04mm; Width: 1.4mm; Height: 1.01mm; Radiation Hardening: No; Reach SVHC Compliant: No; Lead Free: Lead Free; Halogen Free: Halogen Free; RoHS Compliant: Yes; ComponentLink1URL: https://datasheet.ciiva.com/1254/2n7002k-d-1254499.pdf?src-supplier=Newark; ComponentLink1Description: https://datasheet.ciiva.com/1254/2n7002k-d-1254499.pdf?src-supplier=Newark; ComponentLink2URL: https://datasheet.ciiva.com/16220/2n7002k-d-16220919.pdf?src-supplier=Future+Electronics; ComponentLink2Description: https://datasheet.ciiva.com/16220/2n7002k-d-16220919.pdf?src-supplier=Future+Electronics; ComponentLink3URL: https://datasheet.ciiva.com/936/2n7002k-d-936793.pdf?src-supplier=Digikey; ComponentLink3Description: https://datasheet.ciiva.com/936/2n7002k-d-936793.pdf?src-supplier=Digikey; LCSC Part Number: C116584; Item Type: MOSFET
R2 R6 R11 = RC0603JR-07100KL: as R1 on sheet IO-Extender; Supplier 1: Digi-Key; Manufacturer Part Number: RC0603JR-07100KL; RoHS: Yes; Category: Chip SMD Resistors; Stock 1: 1210037; Pricing 1: 1=0.10000, 10=0.02000, 100=0.00800, 1000=0.00360, 2500=0.00312 (USD); Case/Package: 0603; Number of Pins: 2; Contact Plating: Tin,Matte; Case Code (Imperial): 0603; Case Code (Metric): 1608; Size Code: 0603; Min Operating Temperature: -55°C; Max Operating Temperature: 155°C; Tolerance: 5%; Resistor Type: Thick Film; Packaging: Tape and Reel; Voltage Rating (DC): 50V; Termination: SMD/SMT; Features: Moisture Resistant; Series: RC; Max Power Dissipation: 100mW; Number of Terminations: 2; Resistance Tolerance: 5%; Width: 0.8mm; Radiation Hardening: No; REACH SVHC: No SVHC; Lead Free: Lead Free; RoHS Compliant: Yes; ComponentLink1URL: https://datasheet.ciiva.com/7746/443971-7746424.pdf?src-supplier=Element14; ComponentLink1Description: https://datasheet.ciiva.com/7746/443971-7746424.pdf?src-supplier=Element14; ComponentLink2URL: https://datasheet.ciiva.com/7983/443971-7983686.pdf?src-supplier=Element14; ComponentLink2Description: https://datasheet.ciiva.com/7983/443971-7983686.pdf?src-supplier=Element14; ComponentLink3URL: https://datasheet.ciiva.com/7746/443971-7746423.pdf?src-supplier=Element14; ComponentLink3Description: https://datasheet.ciiva.com/7746/443971-7746423.pdf?src-supplier=Element14; ComponentLink4URL: https://datasheet.ciiva.com/8887/pyu-rc0603-51-rohs-l-4-8887903.pdf?src-supplier=Avnet; ComponentLink4Description: https://datasheet.ciiva.com/8887/pyu-rc0603-51-rohs-l-4-8887903.pdf?src-supplier=Avnet; Supplier Part Number 1: 311-100KGRCT-ND; LCSC Part Number: C100048
R3 R5 R12 = RC0603FR-074K7L: as R13 on sheet IO-Extender; Manufacturer Part Number: RC0603FR-074K7L; Package: 0603; ComponentLink7Description: LCSC; ComponentLink7URL: https://www.lcsc.com/product-detail/Chip-Resistor-Surface-Mount_YAGEO-RC0603FR-074K7L_C99782.html; LCSC Part Number: C99782
R4 = RC0603FR-071KL: 100mW Thick Film Resistors 75V ±100ppm/℃ ±1% 1kΩ 0603 Chip Resistor - Surface Mount ROHS; Manufacturer: YAGEO; Manufacturer Part Number: RC0603FR-071KL; LCSC Part Number: C22548; Package: 0603; Item: Resistor; ComponentLink1Description: LCSC; ComponentLink1URL: https://www.lcsc.com/product-detail/Chip-Resistor-Surface-Mount_YAGEO-RC0603FR-071KL_C22548.html

## Nets that join several sheets
+3V3: IO-Extender (7 pins), Connection Powermodule (J1.21 J1.22 J1.23 P4.1), HMI Part (R7.2 R8.2 R9.2 R10.2)
+5V: Connection Powermodule (6 pins), MOSFET Driving (D1.2 P8.1)
GND: IO-Extender (5 pins), Connection Powermodule (10 pins), HMI Part (SW1.1 SW1.3), Pad Connections (J2.6 J2.7 P12.1), MOSFET Driving (6 pins)
VBAT: Connection Powermodule (6 pins), Pad Connections (J2.1 J2.2 P9.1), MOSFET Driving (C2.2 Q1.3 R2.2)
DOCK-COMM: Connection Powermodule (J1.14), Pad Connections (P13.1)
IO_P0_0: IO-Extender (U1.1), Pad Connections (J2.3)
IO_P0_1: IO-Extender (U1.2), MOSFET Driving (R3.1)
IO_P0_2: IO-Extender (U1.3), MOSFET Driving (R5.1)
IO_P0_3: IO-Extender (U1.4), HMI Part (LED2.2)
IO_P0_4: IO-Extender (U1.5), HMI Part (LED3.2)
IO_P0_5: IO-Extender (U1.6), HMI Part (LED4.2)
IO_P0_6: IO-Extender (U1.7), HMI Part (LED5.2)
SCL: IO-Extender (U1.19), Connection Powermodule (J1.18), Pad Connections (J2.5 P14.1 P15.1)
SDA: IO-Extender (U1.20), Connection Powermodule (J1.17), Pad Connections (J2.4 P10.1 P11.1)
SW: Connection Powermodule (J1.11), HMI Part (SW1.2)